# Altium project Sonography-v1.0.PrjPcb (part 2 of 2)

## Sheet Controller_Section.SchDoc
size A; DocumentNumber: 3; SheetNumber: 3; SheetTotal: 4
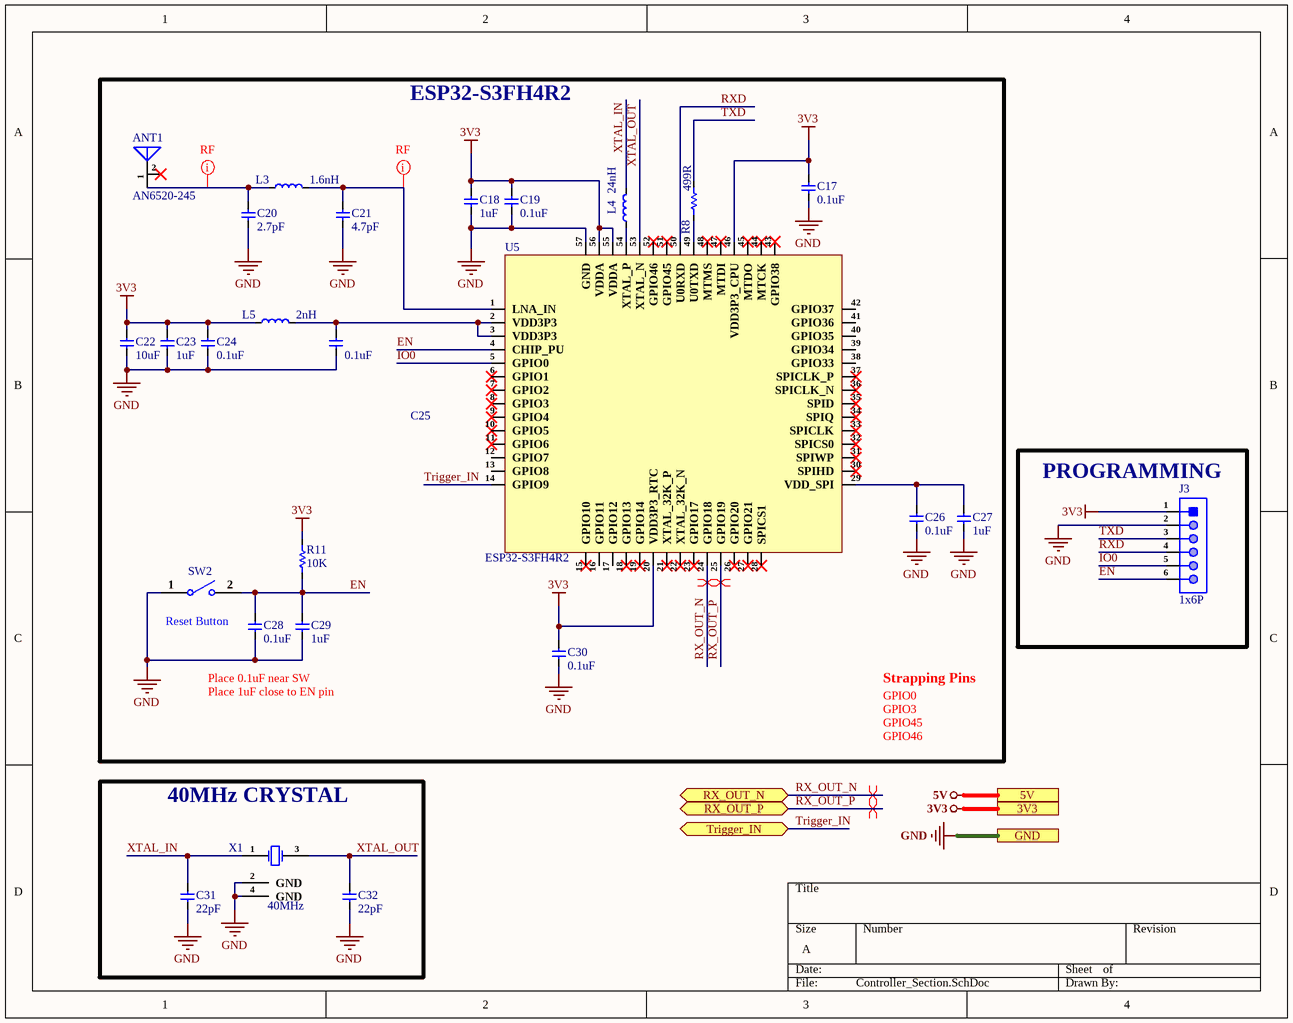
[diagram p2: Controller_Section.SchDoc]

### Parts
ANT1  AN6520-245  [AN6520-245]
C17  0.1uF  [CAP-0201]
C18  1uF  [CAP-0201]
C19  0.1uF  [CAP-0201]
C20  2.7pF  [CAP-0201]
C21  4.7pF  [CAP-0201]
C22  10uF  [Cap-0603]
C23  1uF  [CAP-0201]
C24  0.1uF  [CAP-0201]
C25  0.1uF  [CAP-0201]
C26  0.1uF  [CAP-0201]
C27  1uF  [CAP-0201]
C28  0.1uF  [CAP-0201]
C29  1uF  [CAP-0201]
C30  0.1uF  [CAP-0201]
C31  22pF  [CAP-0201]
C32  22pF  [CAP-0201]
J3  1x6P  [1x6p]
L3  1.6nH  [IND-0201]
L4  24nH  [IND-0201]
L5  2nH  [IND-0201]
R8  499R  [Res-0201]
R11  10K  [Res-0201]
SW2  B3U-1000P  [B3U-1000P]  (value not drawn)
U5  ESP32-S3FH4R2  [QFNWB-56 (7×7)]
X1  40MHz  [X322540MPB4SI_]

### Blocks framed on the sheet
ESP32-S3FH4R2: ANT1 C17-C30 L3-L5 R8 R11 SW2 U5
PROGRAMMING: J3
40MHz CRYSTAL: C31 C32 X1

### Ports
3V3 (see Top_sheet[2B], Power_Section[1D]), 5V (see Top_sheet[2B], Power_Section[1D], Transmitter_Receiver_Section[2D]), GND (see Top_sheet[3C], Power_Section[1D], Transmitter_Receiver_Section[2D]), RX_OUT_N (bidir, see Top_sheet[3B], Transmitter_Receiver_Section[1D]), RX_OUT_P (bidir, see Top_sheet[3B], Transmitter_Receiver_Section[1D]), Trigger_IN (bidir, see Top_sheet[3C], Transmitter_Receiver_Section[1D])

### Nets
3V3: C17.2 C18.2 C19.2 C22.2 C23.2 C24.2 C30.2 J3.1 L5.1 R11.2 U5.20(VDD3P3_RTC) U5.46(VDD3P3_CPU) U5.55(VDDA) U5.56(VDDA) ; port 3V3
GND: C17.1 C18.1 C19.1 C20.1 C21.1 C22.1 C23.1 C24.1 C25.1 C26.1 C27.1 C28.1 C29.1 C30.1 C31.1 C32.1 J3.2 SW2.1 U5.57(GND) X1.2(GND) X1.4(GND) ; port GND
EN: C28.2 C29.2 J3.6 R11.1 SW2.2 U5.4(CHIP_PU)
IO0: J3.5 U5.5(GPIO0)
RX_OUT_N: U5.24(GPIO18) ; port RX_OUT_N
RX_OUT_P: U5.25(GPIO19) ; port RX_OUT_P
RXD: J3.4 U5.50(U0RXD)
Trigger_IN: U5.14(GPIO9) ; port Trigger_IN
TXD: J3.3 R8.2
XTAL_IN: C31.2 L4.2 X1.1(CRYSTAL)
XTAL_OUT: C32.2 U5.53(XTAL_N) X1.3(CRYSTAL)
NetANT1_1: ANT1.1(FEED) C20.2 L3.1
NetC21_2: C21.2 L3.2 U5.1(LNA_IN)
NetC25_2: C25.2 L5.2 U5.2(VDD3P3) U5.3(VDD3P3)
NetC26_2: C26.2 C27.2 U5.29(VDD_SPI)
NetL4_1: L4.1 U5.54(XTAL_P)
NetR8_1: R8.1 U5.49(U0TXD)

Not connected (* = marked no-connect by the designer): ANT1 2(NC)*; U5 6(GPIO1)* 7(GPIO2)* 8(GPIO3)* 9(GPIO4)* 10(GPIO5)* 11(GPIO6)* 12(GPIO7) 13(GPIO8) 15(GPIO10)* 16(GPIO11) 17(GPIO12) 18(GPIO13)* 19(GPIO14)* 21(XTAL_32K_P)* 22(XTAL_32K_N)* 23(GPIO17)* 26(GPIO20)* 27(GPIO21)* 28(SPICS1)* 30(SPIHD)* 31(SPIWP)* 32(SPICS0)* 33(SPICLK)* 34(SPIQ)* 35(SPID)* 36(SPICLK_N)* 37(SPICLK_P)* 38(GPIO33) 39(GPIO34) 40(GPIO35) 41(GPIO36) 42(GPIO37) 43(GPIO38)* 44(MTCK)* 45(MTDO)* 47(MTDI)* 48(MTMS)* 51(GPIO45)* 52(GPIO46)*

### Layout directives
differential pair; differential pair class RX_OUT_Lines; net class RX_OUT; rule Matched Net Lengths [Tolerance = 50mil]; rule Impedance Constraint [Min = 85.00    Max = 90.00    ]: RX_OUT_N, RX_OUT_P
net class RF: NetANT1_1, NetC21_2

### Notes on the sheet
- Reset Button
- Place 1uF close to EN pin
- Place 0.1uF near SW
- Strapping Pins
- GPIO0
  GPIO3
  GPIO45
  GPIO46

### Library data of the parts
ANT1 = AN6520-245: SMD Antennas ROHS; Manufacturer: Rainsun microwave Tech; ComponentLink1Description: LCSC; ComponentLink1URL: https://www.lcsc.com/product-detail/Antennas_Rainsun-microwave-Tech-AN6520-245_C239238.html; Manufacturer Part Number: AN6520-245; Footprint: SMD; LCSC Part Number: C239238
C17 C19 C24-C26 C28 C30 = GRM033R61E104KE14D: CAP CER 0.1UF 25V X5R 0201; Manufacturer: Murata; Tolerance: 10%; Item Type: Capacitor; Material: 4241ConductorMaterial; Value: 100nF; Manufacturer Part Number: GRM033R61E104KE14D; RoHS: Yes; Category: Ceramic Capacitors; Case/Package: 0201; Case Code (Metric): 0603; Case Code (Imperial): 0201; Weight: 1.2E-05oz; Min Operating Temperature: -55°C; Max Operating Temperature: 85°C; Packaging: Tape and Reel; Voltage Rating: 25V; Dielectric: X5R; Termination: SMD/SMT; Voltage Rating (DC): 25V; Package Quantity: 15000; Series: GRM; Length: 0.024inch; Width: 0.012inch; Height: 0.3mm; Thickness: 0.013inch; Lead Free: Lead Free; RoHS Compliant: Yes; ComponentLink1URL: http://www.farnell.com/datasheets/2867843.pdf?src-supplier=Farnell; ComponentLink1Description: http://www.farnell.com/datasheets/2867843.pdf?src-supplier=Farnell; ComponentLink2URL: http://www.mouser.com/ds/2/281/c02e-2905.pdf?src-supplier=Mouser; ComponentLink2Description: http://www.mouser.com/ds/2/281/c02e-2905.pdf?src-supplier=Mouser; ComponentLink3URL: https://datasheet.octopart.com/GRM033R61E104KE14D-Murata-datasheet-22122223.pdf?src-supplier=Future+Electronics; ComponentLink3Description: https://datasheet.octopart.com/GRM033R61E104KE14D-Murata-datasheet-22122223.pdf?src-supplier=Future+Electronics; ComponentLink4URL: http://www.farnell.com/datasheets/2867843.pdf?src-supplier=Element14; ComponentLink4Description: http://www.farnell.com/datasheets/2867843.pdf?src-supplier=Element14; ComponentLink5URL: http://search.murata.co.jp/Ceramy/image/img/A01X/G101/ENG/GRM033R61E104KE14-01.pdf?src-supplier=Digi-Key; ComponentLink5Description: http://search.murata.co.jp/Ceramy/image/img/A01X/G101/ENG/GRM033R61E104KE14-01.pdf?src-supplier=Digi-Key; LCSC Part Number: C76939; Supplier: Rs; Supplier Part Number: 1852066; Stock: 14000; Pricing: 1000=0.008, 5000=0.007, 10000=0.006 (GBP); Mounting Technology: Surface Mount; ComponentLink6URL: http://www.farnell.com/datasheets/2867843.pdf?src-supplier=Newark; ComponentLink6Description: http://www.farnell.com/datasheets/2867843.pdf?src-supplier=Newark; ComponentLink7URL: https://datasheet.octopart.com/GRM033R61E104KE14D-Murata-datasheet-165579666.pdf?src-supplier=TME; ComponentLink7Description: https://datasheet.octopart.com/GRM033R61E104KE14D-Murata-datasheet-165579666.pdf?src-supplier=TME
C18 C23 C27 C29 = GRM033R61C105ME15D: CAP CER 1UF 16V X5R 0201; Manufacturer: Murata; Item Type: Capacitor; Supplier 1: Digi-Key; Manufacturer Part Number: GRM033R61C105ME15D; Stock 1: 12823; Pricing 1: 1=0.14, 10=0.098, 50=0.0554, 100=0.0459, 500=0.0322, 1000=0.02665, 2500=0.02481, 5000=0.0227 (USD); ComponentLink1URL: https://datasheet.octopart.com/GRM033R61C105ME15D-Murata-datasheet-155345049.pdf?src-supplier=Element14; ComponentLink1Description: https://datasheet.octopart.com/GRM033R61C105ME15D-Murata-datasheet-155345049.pdf?src-supplier=Element14; Supplier Part Number 1: 490-18654-1-ND; LCSC Part Number: C335102; RoHS: No; Category: Ceramic Capacitors; ComponentLink2URL: https://datasheet.octopart.com/GRM033R61C105ME15D-Murata-datasheet-165579666.pdf?src-supplier=TME; ComponentLink2Description: https://datasheet.octopart.com/GRM033R61C105ME15D-Murata-datasheet-165579666.pdf?src-supplier=TME
C20 = CC0201CRNPO9BN2R7: CAP CER 2.7PF 50V C0G/NPO 0201; Manufacturer: Yageo; Dielectric: C0G; Item Type: Capacitor; Supplier: Avnet; Supplier Part Number: CC0201CRNPO9BN2R7; Manufacturer Part Number: CC0201CRNPO9BN2R7; RoHS: Yes; Category: Ceramic Capacitors; Stock: 15000; Pricing: 15000=0.0017 (USD); Mounting Technology: Surface Mount; Case/Package: 0201; Case Code (Imperial): 0201; Case Code (Metric): 0603; Weight: 6E-06oz; Min Operating Temperature: -55°C; Max Operating Temperature: 125°C; Value: 2.7pF; Packaging: Tape and Reel; Voltage Rating (DC): 50V; Voltage Rating: 50V; Termination: SMD/SMT; Series: CC; Length: 0.024inch; Width: 0.012inch; Thickness: 0.013inch; RoHS Compliant: Yes; ComponentLink1URL: https://datasheet.ciiva.com/13208/upy-gp-np0-16v-to-50v-8-13208314.pdf?src-supplier=Mouser; ComponentLink1Description: https://datasheet.ciiva.com/13208/upy-gp-np0-16v-to-50v-8-13208314.pdf?src-supplier=Mouser; LCSC Part Number: C325439
C21 = CC0201BRNPO9BN4R7: CAP CER 4.7PF 50V C0G/NPO 0201; Manufacturer: Yageo; Item Type: Capacitor; Supplier: Arrow Electronics; Supplier Part Number: CC0201BRNPO9BN4R7; Manufacturer Part Number: CC0201BRNPO9BN4R7; RoHS: Yes; Category: Ceramic Capacitors; Stock: 210000; Pricing: 15000=0.0023 (USD); Mounting Technology: Surface Mount; Case/Package: 0201; Min Operating Temperature: -55°C; Max Operating Temperature: 125°C; Packaging: Tape and Reel; Value: 4.7pF; Voltage Rating: 50V; Series: CC; Length: 0.024inch; Width: 0.012inch; Thickness: 0.013inch; RoHS Compliant: Yes; ComponentLink1URL: https://www.yageo.com/upload/media/product/productsearch/datasheet/mlcc/UPY-GP_NP0_16V-to-50V_18.pdf?src-supplier=Digi-Key; ComponentLink1Description: https://www.yageo.com/upload/media/product/productsearch/datasheet/mlcc/UPY-GP_NP0_16V-to-50V_18.pdf?src-supplier=Digi-Key; ComponentLink2URL: http://www.yageo.com/documents/recent/UPY-GP_NP0_16V-to-50V_16.pdf?src-supplier=Digi-Key; ComponentLink2Description: http://www.yageo.com/documents/recent/UPY-GP_NP0_16V-to-50V_16.pdf?src-supplier=Digi-Key; LCSC Part Number: C505471
C22 = GRM188R6YA106MA73D: 10uF 35V X5R 20% Pad SMD 0603; Manufacturer: Murata; Supplier 1: Arrow Electronics; Manufacturer Part Number: GRM188R6YA106MA73D; RoHS: Yes; Category: Ceramic Capacitors; Stock 1: 37601; Pricing 1: 1=0.36650, 10=0.23380, 25=0.23160, 100=0.15050, 250=0.14890, 500=0.10700, 1000=0.09270, 3000=0.08640, 6000=0.07720, 15000=0.07140, 30000=0.05840 (USD); Mount: Surface Mount; Case/Package: 0603; Case Code (Metric): 1608; Case Code (Imperial): 0603; Min Operating Temperature: -55°C; Max Operating Temperature: 85°C; Packaging: Tape and Reel; Capacitance: 10uF; Voltage Rating: 35V; Tolerance: 20%; Voltage Rating (DC): 35V; Dielectric: X5R; Length: 0.063inch; Width: 0.031inch; Thickness: 0.039inch; RoHS Compliant: Yes; ComponentLink1URL: http://search.murata.co.jp/Ceramy/image/img/A01X/G101/ENG/GRM188R6YA106MA73-01.pdf?src-supplier=Future+Electronics; ComponentLink1Description: http://search.murata.co.jp/Ceramy/image/img/A01X/G101/ENG/GRM188R6YA106MA73-01.pdf?src-supplier=Future+Electronics; ComponentLink2URL: http://search.murata.co.jp/Ceramy/image/img/A01X/G101/ENG/GRM188R6YA106MA73-01.pdf?src-supplier=Digi-Key; ComponentLink2Description: http://search.murata.co.jp/Ceramy/image/img/A01X/G101/ENG/GRM188R6YA106MA73-01.pdf?src-supplier=Digi-Key; ComponentLink3URL: https://www.murata.com/~/media/webrenewal/support/library/catalog/products/capacitor/mlcc/c02e.ashx?la=en-us&src-supplier=Digi-Key; ComponentLink3Description: https://www.murata.com/~/media/webrenewal/support/library/catalog/products/capacitor/mlcc/c02e.ashx?la=en-us&src-supplier=Digi-Key; ComponentLink4URL: http://search.murata.co.jp/Ceramy/image/img/A01X/G101/ENG/GRM188R6YA106MA73-01.pdf?src-supplier=Mouser; ComponentLink4Description: http://search.murata.co.jp/Ceramy/image/img/A01X/G101/ENG/GRM188R6YA106MA73-01.pdf?src-supplier=Mouser; ComponentLink5URL: http://search.murata.co.jp/Ceramy/image/img/A01X/G101/ENG/GRM188R6YA106MA73-01.pdf?src-supplier=TTI; ComponentLink5Description: http://search.murata.co.jp/Ceramy/image/img/A01X/G101/ENG/GRM188R6YA106MA73-01.pdf?src-supplier=TTI; Supplier Part Number 1: GRM188R6YA106MA73D; LCSC Part Number: C194427
C31 C32 = GRM0335C1H220JA01D: CAP CER 22PF 50V C0G/NP0 0201; Manufacturer: Murata; Tolerance: 5%; Dielectric: C0G; Temperature Coefficient: 30ppm/°C; Item Type: Capacitor; Material: 4241ConductorMaterial; Manufacturer Part Number: GRM0335C1H220JA01D; RoHS: Yes; Category: Ceramic Capacitors; Mounting Technology: Surface Mount; Case/Package: 0201; Case Code (Metric): 0603; Case Code (Imperial): 0201; Min Operating Temperature: -55°C; Max Operating Temperature: 125°C; Value: 22pF; Voltage Rating: 50V; Packaging: Tape and Reel; Package Quantity: 1; Voltage Rating (DC): 50V; Termination: SMD/SMT; Voltage: 50V; Series: GRM; Length: 0.024inch; Width: 0.012inch; Height: 0.3mm; Depth: 0.3mm; Lead Free: Lead Free; RoHS Compliant: Yes; ComponentLink1URL: https://datasheet.ciiva.com/6271/partnumbering-e-01-6271146.pdf?src-supplier=Digi-Key; ComponentLink1Description: https://datasheet.ciiva.com/6271/partnumbering-e-01-6271146.pdf?src-supplier=Digi-Key; ComponentLink2URL: https://datasheet.ciiva.com/6271/partnumbering-e-01-6271143.pdf?src-supplier=Digi-Key; ComponentLink2Description: https://datasheet.ciiva.com/6271/partnumbering-e-01-6271143.pdf?src-supplier=Digi-Key; ComponentLink3URL: https://datasheet.ciiva.com/6271/partnumbering-e-01-6271149.pdf?src-supplier=Digi-Key; ComponentLink3Description: https://datasheet.ciiva.com/6271/partnumbering-e-01-6271149.pdf?src-supplier=Digi-Key; LCSC Part Number: C76924; Supplier: Rs; Supplier Part Number: 8202728; Stock: 9500; Pricing: 500=0.004, 5000=0.003, 12500=0.002, 50000=0.002 (GBP)
L3 = LQP03HQ1N6B02D: FIXED IND 1.6NH 1A 50 MOHM SMD; Manufacturer: Murata; Core Material: Non-Magnetic; Shielding: Unshielded; DC Resistance (DCR): 50mR; Self Resonant Frequency: 10GHz; Test Frequency: 500MHz; Item Type: Inductor; Supplier: Digi-Key; Supplier Part Number: 490-13883-1-ND; Manufacturer Part Number: LQP03HQ1N6B02D; RoHS: Yes; Category: Fixed Inductors; Stock: 27606; Pricing: 1=0.16, 10=0.145, 25=0.1236, 50=0.109, 100=0.1, 250=0.09088, 500=0.08544, 1000=0.06545, 2500=0.06181 (USD); Mounting Technology: Surface Mount; Case/Package: 0201; Case Code (Imperial): 0201; Case Code (Metric): 0603; Min Operating Temperature: -55°C; Max Operating Temperature: 125°C; Packaging: Cut Tape; Value: 1.6nH; Current Rating: 1A; Series: LQP03; RoHS Compliant: Yes; ComponentLink1URL: http://search.murata.co.jp/Ceramy/image/img/P02/JELF243C-0021.pdf?src-supplier=Digi-Key; ComponentLink1Description: http://search.murata.co.jp/Ceramy/image/img/P02/JELF243C-0021.pdf?src-supplier=Digi-Key; LCSC Part Number: C237384
L4 = LQP03TN24NH02D: 140mA 24nH ±3% 2.3Ω 0201 Inductors (SMD) ROHS; Manufacturer: Murata; Core Material: Non-Magnetic; Shielding: Unshielded; DC Resistance (DCR): 2.3R; Self Resonant Frequency: 2GHz; Test Frequency: 500MHz; Supplier: Digi-Key; Supplier Part Number: 490-13004-1-ND; Manufacturer Part Number: LQP03TN24NH02D; RoHS: Yes; Category: Fixed Inductors; Stock: 40849; Pricing: 1=0.1, 10=0.041, 25=0.0364, 50=0.031, 100=0.0273, 250=0.025, 500=0.02272, 1000=0.01909, 2500=0.01636 (USD); Mounting Technology: Surface Mount; Case/Package: 0201; Case Code (Metric): 0603; Case Code (Imperial): 0201; Min Operating Temperature: -55°C; Max Operating Temperature: 125°C; Package Quantity: 15000; Packaging: Tape and Reel; Tolerance: 3%; Current Rating: 140mA; Value: 24nH; DC Current: 140mA; Series: LQP03TN_02; Technology: THIN FILM; Length: 0.024inch; Width: 0.012inch; Height - Seated (Max): 0.013inch; Depth: 0.33mm; Military Standard: Not; RoHS Compliant: Yes; ComponentLink1URL: https://datasheet.ciiva.com/29692/s0084e-29692461.pdf?src-supplier=Digi-Key; ComponentLink1Description: https://datasheet.ciiva.com/29692/s0084e-29692461.pdf?src-supplier=Digi-Key; LCSC Part Number: C206441; Item Type: Inductor
L5 = MLG0603P2N0CT000: FIXED IND 2NH 600MA 100 MOHM SMD; Manufacturer: TDK; Item Type: Inductor; Core Material: Non-Magnetic; Shielding: Unshielded; DC Resistance (DCR): 100mR; Self Resonant Frequency: 8.5GHz; Test Frequency: 500MHz; Supplier: Digi-Key; Supplier Part Number: 445-172431-1-ND; Manufacturer Part Number: MLG0603P2N0CT000; RoHS: Yes; Category: Fixed Inductors; Stock: 23499; Pricing: 1=0.13, 10=0.118, 25=0.1, 50=0.0882, 100=0.0808, 250=0.07352, 500=0.06908, 1000=0.05292, 2500=0.04998 (USD); ComponentLink1URL: https://datasheet.ciiva.com/41860/inductor-commercial-high-frequency-mlg-qp-en-41860968.pdf?src-supplier=Digi-Key; ComponentLink1Description: https://datasheet.ciiva.com/41860/inductor-commercial-high-frequency-mlg-qp-en-41860968.pdf?src-supplier=Digi-Key; LCSC Part Number: C531323; Mounting Technology: Surface Mount; Case/Package: 0201; Case Code (Metric): 0603; Case Code (Imperial): 0201; Min Operating Temperature: -55°C; Max Operating Temperature: 125°C; Package Quantity: 15000; Packaging: Cut Tape; Current Rating: 600mA; Value: 2nH; Series: MLG-P; Length: 0.024inch; Width: 0.012inch; Height - Seated (Max): 0.013inch; RoHS Compliant: Yes
R8 = RC0201FR-07499RL: RES 499 OHM 1% 1/20W 0201; Manufacturer: Yageo; Max Power Dissipation: 50mW; Temperature Coefficient: 200ppm/°C; Item Type: Resistor; Supplier 1: Avnet; Manufacturer Part Number: RC0201FR-07499RL; RoHS: Yes; Category: Chip SMD Resistors; Stock 1: 150000; Pricing 1: 10000=0.00128 (USD); Case/Package: 0201; Case Code (Metric): 0603; Case Code (Imperial): 0201; Min Operating Temperature: -55°C; Max Operating Temperature: 125°C; Resistance: 499R; Tolerance: 1%; Packaging: Tape and Reel; Resistor Type: Thick Film; Number of Terminations: 2; Features: Moisture Resistant; Length: 0.024inch; Width: 0.012inch; Height: 0.01inch; Depth: 0.3mm; RoHS Compliant: Yes; Military Standard: Not; Lead Free: Lead Free; ComponentLink1URL: http://www.yageo.com/documents/recent/PYu-RC_Group_51_RoHS_L_10.pdf?src-supplier=Digi-Key; ComponentLink1Description: http://www.yageo.com/documents/recent/PYu-RC_Group_51_RoHS_L_10.pdf?src-supplier=Digi-Key; ComponentLink2URL: http://www.yageo.com/documents/recent/PYu-RC_Group_51_RoHS_L_9.pdf?src-supplier=Digi-Key; ComponentLink2Description: http://www.yageo.com/documents/recent/PYu-RC_Group_51_RoHS_L_9.pdf?src-supplier=Digi-Key; Supplier Part Number 1: RC0201FR-07499RL; LCSC Part Number: C138137
R11 = RC0201FR-0710KL: RES SMD 10K OHM 1% 1/20W 0201; Manufacturer: Yageo; Item Type: Resistor; Manufacturer Part Number: RC0201FR-0710KL; Package: 0201; ComponentLink7Description: LCSC; ComponentLink7URL: https://www.lcsc.com/product-detail/Chip-Resistor-Surface-Mount_YAGEO-RC0201FR-0710KL_C106225.html; LCSC Part Number: C106225
SW2 = B3U-1000P: SWITCH TACTILE SPST-NO 0.05A 12V; Manufacturer: Omron; Mechanical Life: 200000Cycles; Operating Force: 1.5N; Throw Configuration: SPST; Current Rating: 50mA; Contact Resistance: 100mR; Illumination Type: Non-Illuminated,Illuminated; Switch Travel: 0.15mm; Switch Function: Off-Mom; Actuator Type: Standard; Actuator Length: 0.4mm; Ratings: Dust Proof,IP40; ComponentLink1URL: http://www.farnell.com/datasheets/60838.pdf?src-supplier=Farnell; ComponentLink1Description: http://www.farnell.com/datasheets/60838.pdf?src-supplier=Farnell; ComponentLink2URL: http://www.farnell.com/datasheets/60838.pdf?src-supplier=Element14; ComponentLink2Description: http://www.farnell.com/datasheets/60838.pdf?src-supplier=Element14; ComponentLink3URL: https://omronfs.omron.com/en_US/ecb/products/pdf/en-b3u.pdf?src-supplier=Digi-Key; ComponentLink3Description: https://omronfs.omron.com/en_US/ecb/products/pdf/en-b3u.pdf?src-supplier=Digi-Key; ComponentLink4URL: http://www.omron.com/ecb/products/pdf/en-b3u.pdf?src-supplier=Digi-Key; ComponentLink4Description: http://www.omron.com/ecb/products/pdf/en-b3u.pdf?src-supplier=Digi-Key; ComponentLink5URL: https://www.distrelec.biz/Web/Downloads/he/et/B3U_eng_datasheet.pdf?mime=application%2Fpdf&src-supplier=Distrelec; ComponentLink5Description: https://www.distrelec.biz/Web/Downloads/he/et/B3U_eng_datasheet.pdf?mime=application%2Fpdf&src-supplier=Distrelec; ComponentLink6URL: http://www.onlinecomponents.com/productFiles/mf-OM/en-b3u.pdf?src-supplier=Onlinecomponents.com; ComponentLink6Description: http://www.onlinecomponents.com/productFiles/mf-OM/en-b3u.pdf?src-supplier=Onlinecomponents.com; Supplier 1: Digi-Key; Manufacturer Part Number: B3U-1000P; Stock 1: 116454; Pricing 1: 1=1, 10=0.961, 25=0.9064, 50=0.7976, 100=0.7251, 250=0.68888, 500=0.67074, 1000=0.52571 (USD); Mount: Surface Mount; Weight: 0.000776oz; Contact Material: Silver; Min Operating Temperature: -25°C; Max Operating Temperature: 70°C; Packaging: Tape and Reel; Voltage Rating (DC): 12V; Package Quantity: 1; Max Current Rating: 50mA; Termination: SMD/SMT; Orientation: Straight; Max Voltage Rating (DC): 12V; Electrical Life: 200000Cycles; Insulation Resistance: 100MR; Contact Current Rating: 50mA; Length: 4mm; Height: 1.2mm; Depth: 2.5mm; Width: 3mm; REACH SVHC: Unknown; Lead Free: Lead Free; ComponentLink7URL: https://www.verical.com/server-webapp/html/getDatasheet?partID=552554&src-supplier=Verical; ComponentLink7Description: https://www.verical.com/server-webapp/html/getDatasheet?partID=552554&src-supplier=Verical; ComponentLink8URL: http://www.farnell.com/datasheets/1685550.pdf?src-supplier=Element14; ComponentLink8Description: http://www.farnell.com/datasheets/1685550.pdf?src-supplier=Element14; ComponentLink9URL: http://www.farnell.com/datasheets/2610940.pdf?src-supplier=Farnell; ComponentLink9Description: http://www.farnell.com/datasheets/2610940.pdf?src-supplier=Farnell; ComponentLink10URL: https://www.alliedelec.com/m/d/4c8a9ef82804fc3c241a13c1e298fd73.pdf?src-supplier=Allied+Electronics; ComponentLink10Description: https://www.alliedelec.com/m/d/4c8a9ef82804fc3c241a13c1e298fd73.pdf?src-supplier=Allied+Electronics; Supplier Part Number 1: SW1020DKR-ND; LCSC Part Number: C231329; Item Type: Switch
U5 = ESP32-S3FH4R2: 21dBm ESP32-S3R8 2.4GHz SMD WiFi Modules ROHS; Manufacturer: Espressif Systems; Item Type: IC; Supplier: Mouser; Supplier Part Number: 356-ESP32-S3FH4R2; Manufacturer Part Number: ESP32-S3FH4R2; RoHS: No; Stock: 2650; Pricing: 1=2.32, 10=2.32, 50=2.32, 100=2.32, 1000=2.32, 10000=2.32 (USD); LCSC Part Number: C3013940; ComponentLink1Description: LCSC; ComponentLink1URL: https://www.lcsc.com/product-detail/WiFi-Modules_Espressif-Systems-ESP32-S3FH4R2_C3013940.html
X1 = X322540MPB4SI: 40MHz SMD Crystal Resonator 15pF SMD3225-4P Crystals ROHS; Manufacturer: Yangxing Tech; Manufacturer Part Number: X322540MPB4SI; Value: 40MHZ; LCSC Part Number: C9010; ComponentLink1Description: LCSC; ComponentLink1URL: https://www.lcsc.com/product-detail/Crystals_Yangxing-Tech-X322540MPB4SI_C9010.html; Item Type: Crystal

## Sheet Power_Section.SchDoc
size A; DocumentNumber: 2; SheetNumber: 2; SheetTotal: 4
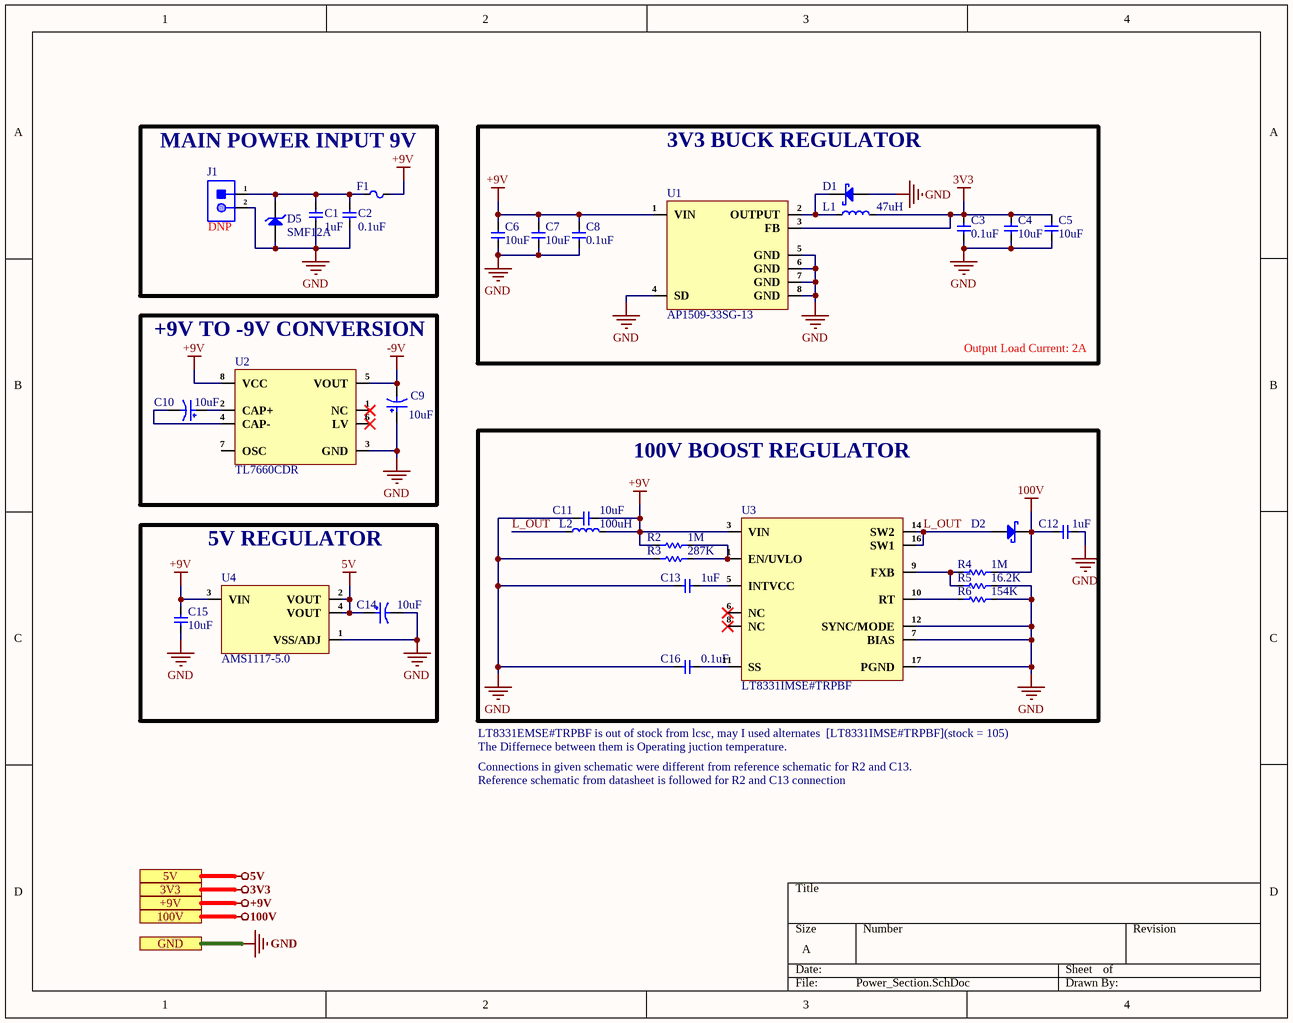
[diagram p3: Power_Section.SchDoc]

### Parts
C1  1uF  [CAP-0201]
C2  0.1uF  [CAP-0201]
C3  0.1uF  [CAP-0201]
C4  10uF  [Cap-0603]
C5  10uF  [Cap-0603]
C6  10uF  [Cap-0603]
C7  10uF  [Cap-0603]
C8  0.1uF  [CAP-0201]
C9  10uF  [Case-B]
C10  10uF  [Case-B]
C11  10uF  [Cap-0603]
C12  1uF  [Cap-1812]
C13  1uF  [CAP-0201]
C14  10uF  [Case-B]
C15  10uF  [Cap-0603]
C16  0.1uF  [CAP-0201]
D1  B340A  [SMA(DO-214AC)]  (value not drawn)
D2  RB558VAM150TR  [SOD-323HE]  (value not drawn)
D5  SMF12A  [SOD-123F]
F1  SMD2018-200  [SMD2018-200]  (value not drawn)
J1  X6521WVS-2x01H-C60D74  [X6521WVS-2x01H-C60D74]  (value not drawn)
L1  47uH  [SMMS1050-470M]
L2  100uH  [SDR1307A-101K]
R2  1M  [Res-0402]
R3  287K  [Res-0201]
R4  1M  [Res-0402]
R5  16.2K  [Res-0201]
R6  154K  [Res-0201]
U1  AP1509-33SG-13  [SOP-8L]
U2  TL7660CDR  [SOIC-8(0.154", 3.90mm Width)]
U3  LT8331IMSE#TRPBF  [16-MSOP-EP]
U4  AMS1117-5.0  [SOT- 223]

### Blocks framed on the sheet
MAIN POWER INPUT 9V: C1 C2 D5 F1 J1
3V3 BUCK REGULATOR: C3-C8 D1 L1 U1
+9V TO -9V CONVERSION: C9 C10 U2
100V BOOST REGULATOR: C11-C13 C16 D2 L2 R2-R6 U3
5V REGULATOR: C14 C15 U4

### Ports
3V3 (see Top_sheet[1B], Controller_Section[4D]), 5V (see Top_sheet[1B], Controller_Section[4D], Transmitter_Receiver_Section[2D]), 100V (see Top_sheet[1B], Transmitter_Receiver_Section[2D]), +9V (see Top_sheet[1B], Transmitter_Receiver_Section[2D]), GND (see Top_sheet[2C], Controller_Section[4D], Transmitter_Receiver_Section[2D])

### Nets
3V3: C3.2 C4.2 C5.2 L1.2 U1.3(FB) ; port 3V3
5V: C14.1 U4.2(VOUT) U4.4(VOUT) ; port 5V
100V: C12.2 D2.1(K) R4.2 ; port 100V
+9V: C6.2 C7.2 C8.2 C11.1 C15.2 F1.2 L2.2 R2.1 U1.1(VIN) U2.8(VCC) U3.3(VIN) U4.3(VIN) ; port +9V
-9V: C9.2 U2.5(VOUT)
GND: C1.1 C2.1 C3.1 C4.1 C5.1 C6.1 C7.1 C8.1 C9.1 C11.2 C12.1 C13.2 C14.2 C15.1 C16.2 D1.2(A) D5.2(A) J1.2 R3.1 R5.2 R6.2 U1.4(SD) U1.5(GND) U1.6(GND) U1.7(GND) U1.8(GND) U2.3(GND) U3.7(BIAS) U3.12(SYNC/MODE) U3.17(PGND) U4.1(VSS/ADJ) ; port GND
L_OUT: D2.2(A) L2.1 U3.14(SW2) U3.16(SW1)
NetC1_2: C1.2 C2.2 D5.1(K) F1.1 J1.1
NetC10_1: C10.1 U2.2(CAP+)
NetC10_2: C10.2 U2.4(CAP-)
NetC13_1: C13.1 U3.5(INTVCC)
NetC16_1: C16.1 U3.11(SS)
NetD1_1: D1.1(K) L1.1 U1.2(OUTPUT)
NetR2_2: R2.2 R3.2 U3.1(EN/UVLO)
NetR4_1: R4.1 R5.1 U3.9(FXB)
NetR6_1: R6.1 U3.10(RT)

Not connected (* = marked no-connect by the designer): U2 1(NC)* 6(LV)* 7(OSC); U3 6(NC)* 8(NC)*

### Notes on the sheet
- (near J1) DNP
- Output Load Current: 2A
- LT8331EMSE#TRPBF is out of stock from lcsc, may I used alternates  [LT8331IMSE#TRPBF](stock = 105)
- The Differnece between them is Operating juction temperature.
- Connections in given schematic were different from reference schematic for R2 and C13.
- Reference schematic from datasheet is followed for R2 and C13 connection

### Library data of the parts
C1 C13 = GRM033R61C105ME15D: as C18 on sheet Controller_Section; Supplier 1: Digi-Key; Manufacturer Part Number: GRM033R61C105ME15D; RoHS: No; Category: Ceramic Capacitors; Stock 1: 12823; Pricing 1: 1=0.14, 10=0.098, 50=0.0554, 100=0.0459, 500=0.0322, 1000=0.02665, 2500=0.02481, 5000=0.0227 (USD); ComponentLink1URL: https://datasheet.octopart.com/GRM033R61C105ME15D-Murata-datasheet-155345049.pdf?src-supplier=Element14; ComponentLink1Description: https://datasheet.octopart.com/GRM033R61C105ME15D-Murata-datasheet-155345049.pdf?src-supplier=Element14; ComponentLink2URL: https://datasheet.octopart.com/GRM033R61C105ME15D-Murata-datasheet-165579666.pdf?src-supplier=TME; ComponentLink2Description: https://datasheet.octopart.com/GRM033R61C105ME15D-Murata-datasheet-165579666.pdf?src-supplier=TME; LCSC Part Number: C335102; Supplier Part Number 1: 490-18654-1-ND
C2 C3 C8 C16 = GRM033R61E104KE14D: CAP CER 0.1UF 25V X5R 0201; Manufacturer: Murata; Material: 4241ConductorMaterial; Value: 100nF; Tolerance: 10%; Item Type: Capacitor; Supplier: Rs; Supplier Part Number: 1852066; Manufacturer Part Number: GRM033R61E104KE14D; RoHS: Yes; Category: Ceramic Capacitors; Stock: 14000; Pricing: 1000=0.008, 5000=0.007, 10000=0.006 (GBP); Mounting Technology: Surface Mount; Case/Package: 0201; Case Code (Metric): 0603; Case Code (Imperial): 0201; Weight: 1.2E-05oz; Min Operating Temperature: -55°C; Max Operating Temperature: 85°C; Packaging: Tape and Reel; Voltage Rating: 25V; Dielectric: X5R; Termination: SMD/SMT; Voltage Rating (DC): 25V; Package Quantity: 15000; Series: GRM; Length: 0.024inch; Width: 0.012inch; Height: 0.3mm; Thickness: 0.013inch; Lead Free: Lead Free; RoHS Compliant: Yes; ComponentLink1URL: http://www.farnell.com/datasheets/2867843.pdf?src-supplier=Farnell; ComponentLink1Description: http://www.farnell.com/datasheets/2867843.pdf?src-supplier=Farnell; ComponentLink2URL: http://www.mouser.com/ds/2/281/c02e-2905.pdf?src-supplier=Mouser; ComponentLink2Description: http://www.mouser.com/ds/2/281/c02e-2905.pdf?src-supplier=Mouser; ComponentLink3URL: https://datasheet.octopart.com/GRM033R61E104KE14D-Murata-datasheet-22122223.pdf?src-supplier=Future+Electronics; ComponentLink3Description: https://datasheet.octopart.com/GRM033R61E104KE14D-Murata-datasheet-22122223.pdf?src-supplier=Future+Electronics; ComponentLink4URL: http://www.farnell.com/datasheets/2867843.pdf?src-supplier=Element14; ComponentLink4Description: http://www.farnell.com/datasheets/2867843.pdf?src-supplier=Element14; ComponentLink5URL: http://search.murata.co.jp/Ceramy/image/img/A01X/G101/ENG/GRM033R61E104KE14-01.pdf?src-supplier=Digi-Key; ComponentLink5Description: http://search.murata.co.jp/Ceramy/image/img/A01X/G101/ENG/GRM033R61E104KE14-01.pdf?src-supplier=Digi-Key; ComponentLink6URL: http://www.farnell.com/datasheets/2867843.pdf?src-supplier=Newark; ComponentLink6Description: http://www.farnell.com/datasheets/2867843.pdf?src-supplier=Newark; ComponentLink7URL: https://datasheet.octopart.com/GRM033R61E104KE14D-Murata-datasheet-165579666.pdf?src-supplier=TME; ComponentLink7Description: https://datasheet.octopart.com/GRM033R61E104KE14D-Murata-datasheet-165579666.pdf?src-supplier=TME; LCSC Part Number: C76939
C4-C7 C11 C15 = GRM188R6YA106MA73D: as C22 on sheet Controller_Section; Supplier 1: Arrow Electronics; Manufacturer Part Number: GRM188R6YA106MA73D; RoHS: Yes; Category: Ceramic Capacitors; Stock 1: 37601; Pricing 1: 1=0.36650, 10=0.23380, 25=0.23160, 100=0.15050, 250=0.14890, 500=0.10700, 1000=0.09270, 3000=0.08640, 6000=0.07720, 15000=0.07140, 30000=0.05840 (USD); Mount: Surface Mount; Case/Package: 0603; Case Code (Metric): 1608; Case Code (Imperial): 0603; Min Operating Temperature: -55°C; Max Operating Temperature: 85°C; Packaging: Tape and Reel; Capacitance: 10uF; Voltage Rating: 35V; Tolerance: 20%; Voltage Rating (DC): 35V; Dielectric: X5R; Length: 0.063inch; Width: 0.031inch; Thickness: 0.039inch; RoHS Compliant: Yes; ComponentLink1URL: http://search.murata.co.jp/Ceramy/image/img/A01X/G101/ENG/GRM188R6YA106MA73-01.pdf?src-supplier=Future+Electronics; ComponentLink1Description: http://search.murata.co.jp/Ceramy/image/img/A01X/G101/ENG/GRM188R6YA106MA73-01.pdf?src-supplier=Future+Electronics; ComponentLink2URL: http://search.murata.co.jp/Ceramy/image/img/A01X/G101/ENG/GRM188R6YA106MA73-01.pdf?src-supplier=Digi-Key; ComponentLink2Description: http://search.murata.co.jp/Ceramy/image/img/A01X/G101/ENG/GRM188R6YA106MA73-01.pdf?src-supplier=Digi-Key; ComponentLink3URL: https://www.murata.com/~/media/webrenewal/support/library/catalog/products/capacitor/mlcc/c02e.ashx?la=en-us&src-supplier=Digi-Key; ComponentLink3Description: https://www.murata.com/~/media/webrenewal/support/library/catalog/products/capacitor/mlcc/c02e.ashx?la=en-us&src-supplier=Digi-Key; ComponentLink4URL: http://search.murata.co.jp/Ceramy/image/img/A01X/G101/ENG/GRM188R6YA106MA73-01.pdf?src-supplier=Mouser; ComponentLink4Description: http://search.murata.co.jp/Ceramy/image/img/A01X/G101/ENG/GRM188R6YA106MA73-01.pdf?src-supplier=Mouser; ComponentLink5URL: http://search.murata.co.jp/Ceramy/image/img/A01X/G101/ENG/GRM188R6YA106MA73-01.pdf?src-supplier=TTI; ComponentLink5Description: http://search.murata.co.jp/Ceramy/image/img/A01X/G101/ENG/GRM188R6YA106MA73-01.pdf?src-supplier=TTI; Supplier Part Number 1: GRM188R6YA106MA73D; LCSC Part Number: C194427
C9 C10 C14 = CA45-B025K106T: 10uF 25V 2.5Ω@100kHz ±10% CASE-B-3528 Tantalum Capacitors ROHS; Manufacturer: Xiangyee in S&T; Manufacturer Part Number: CA45-B025K106T; ComponentLink1URL: https://www.lcsc.com/product-detail/Tantalum-Capacitors_Hunan-Xiangyee-in-S-T-CA45-B025K106T_C119050.html; ComponentLink1Description: LCSC; LCSC Part Number: C119050; Item Type: Capacitor; Package: Case-B
C12 = FS43X105K251EGG: 250V 1uF X7R ±10% 1812 Multilayer Ceramic Capacitors MLCC - SMD/SMT ROHS; Manufacturer: PSA; Manufacturer Part Number: FS43X105K251EGG; Package: 1812; LCSC Part Number: C381468; Item Type: Capacitor; ComponentLink1Description: LCSC; ComponentLink1URL: https://www.lcsc.com/product-detail/Multilayer-Ceramic-Capacitors-MLCC-SMD-SMT_PSA-Prosperity-Dielectrics-FS43X105K251EGG_C381468.html
D1 = B340A: 40V 3A 550mV@3A SMA(DO-214AC) Schottky Barrier Diodes (SBD) ROHS; Manufacturer: FUXINSEMI; Item Type: Diode; Manufacturer Part Number: B340A; Package: SMA(DO-214AC); LCSC Part Number: C3018525; ComponentLink1Description: LCSC; ComponentLink1URL: https://www.lcsc.com/product-detail/Schottky-Barrier-Diodes-SBD_FUXINSEMI-B340A_C3018525.html
D2 = RB558VAM150TR: Diode Schottky 150V 500mA 2-Pin SOD-323HE Emboss T/R; Manufacturer: Rohm; Item Type: Schottky Barrier Diodes; Supplier: Digi-Key; Supplier Part Number: 846-RB558VAM150TR-ND; Manufacturer Part Number: RB558VAM150TR; RoHS: Yes; Category: Schottky Diodes; Stock: 30000; Pricing: 3000=0.07231, 6000=0.06914, 9000=0.05979, 30000=0.05867, 75000=0.04858, 150000=0.04783 (USD); Mounting Technology: Surface Mount; Case/Package: SMD/SMT; Series: *; Average Rectified Current: 500mA; Max Reverse Voltage (DC): 150V; RoHS Compliant: Yes; LCSC Part Number: C5336764
D5 = SMF12A: 10.1A 200W 19.9V 13.3V 12V SOD-123F Electrostatic and Surge Protection (TVS/ESD) ROHS; Manufacturer: Shandong Jingdao Microelectronics; Item Type: Diode; LCSC Part Number: C178259; Manufacturer Part Number: SMF12A; Package: SOD-123F; ComponentLink7Description: LCSC; ComponentLink7URL: https://www.lcsc.com/product-detail/TVS_AnBon-SMBJ5-0A_C440263.html
F1 = SMD2018-200: 10V 2A 100A 4A 2018 Resettable Fuses ROHS; Manufacturer: Tech Fuse; Item type: Fuse; ComponentLink1Description: LCSC; ComponentLink1URL: https://www.lcsc.com/product-detail/Resettable-Fuses_TECHFUSE-SMD2018-200_C70152.html; Manufacturer Part Number: SMD2018-200; Package: 2018; LCSC Part Number: C70152
J1 = X6521WVS-2x01H-C60D74: Gold 250V 3A Brick nogging Square Pins 2.5mm 2P 260℃ 6mm -40℃~+105℃ 2.54mm 双排 Black Brass 2x1P SMD,P=2.54mm Pin Headers ROHS; Manufacturer: XKB Connectivity; Item Type: Connector; Manufacturer Part Number: X6521WVS-2x01H-C60D74; Package: SMD,P=2.54mm; LCSC Part Number: C2884014; ComponentLink1Description: LCSC; ComponentLink1URL: https://www.lcsc.com/product-detail/Pin-Headers_XKB-Connectivity-X6521WVS-2x01H-C60D74_C2884014.html
L1 = SMMS1050-470M: 3A 47uH Molding Choke ±20% 4.5A SMD Power Inductors ROHS; Manufacturer: SXN; Footprint: SMD; Manufacturer Part Number: SMMS1050-470M; Value: 47uH; LCSC Part Number: C149548; ComponentLink1Description: LCSC; ComponentLink1URL: https://www.lcsc.com/product-detail/Power-Inductors_SXN-Shun-Xiang-Nuo-Elec-SMMS1050-470M_C149548.html
L2 = SDR1307A-101K: Ind Power Unshielded Wirewound 100uH 10% 100KHz 25Q-Factor Ferrite 1.9A T/R; Manufacturer: Bourns; Item Type: Inductor; Supplier: Digi-Key; Supplier Part Number: SDR1307A-101KCT-ND; Manufacturer Part Number: SDR1307A-101K; RoHS: Yes; Category: Fixed Inductors; Stock: 2952; Pricing: 1=1.16, 10=0.982, 25=0.8928, 50=0.8392, 100=0.6964 (USD); ComponentLink1URL: https://datasheet.ciiva.com/46435/1778094-46435133.pdf?src-supplier=Element14; ComponentLink1Description: https://datasheet.ciiva.com/46435/1778094-46435133.pdf?src-supplier=Element14; LCSC Part Number: C2042930; ComponentLink2Description: LCSC; ComponentLink2URL: https://www.lcsc.com/product-detail/Power-Inductors_BOURNS-SDR1307A-101K_C2042930.html
R2 R4 = WF04H1004DTL: 125mW ±100ppm/℃ ±0.5% 1MΩ 0402 Chip Resistor - Surface Mount ROHS; Manuacturer: Walsin Tech Crop; Manufacturer Part Number: WF04H1004DTL; Package: 0402; Value: 1M; LCSC Part Number: C305257; ComponentLink1Description: LCSC; ComponentLink1URL: https://www.lcsc.com/product-detail/Chip-Resistor-Surface-Mount_Walsin-Tech-Corp-WF04H1004DTL_C305257.html
R3 = RC0201FR-07287KL: SMD Chip Resistor, 287 kOhm, ± 1%, 50 mW, 0201 [0603 Metric], Thick Film, General Purpose; Manufacturer: YAGEO; Value: 287kR; Max Power Dissipation: 50mW; Temperature Coefficient: 200ppm/°C; Voltage Rating: 25V; Manufacturer Part Number: RC0201FR-07287KL; LCSC Part Number: C474636; Item Type: Resistor; Package: 0201; ComponentLink1Description: LCSC; ComponentLink1URL: https://www.lcsc.com/product-detail/Chip-Resistor-Surface-Mount_YAGEO-RC0201FR-07287KL_C474636.html; Supplier: Arrow Electronics; Supplier Part Number: RC0201FR-07287KL; RoHS: Yes; Category: Chip SMD Resistors; Stock: 19914; Pricing: 1=0.057, 10=0.0097, 25=0.0092, 100=0.0057, 250=0.0056, 500=0.0054, 1000=0.0034, 3000=0.0032, 6000=0.0023 (USD); Case/Package: 0201; Case Code (Metric): 0603; Case Code (Imperial): 0201; Min Operating Temperature: -55°C; Max Operating Temperature: 125°C; Packaging: Cut Tape; Number of Terminations: 2; Tolerance: 1%; Features: Moisture Resistant; Series: RC; Length: 0.024inch; Width: 0.012inch; Height: 0.01inch; RoHS Compliant: Yes; ComponentLink2URL: http://www.yageo.com/documents/recent/PYu-RC_Group_51_RoHS_L_9.pdf?src-supplier=Digi-Key; ComponentLink2Description: http://www.yageo.com/documents/recent/PYu-RC_Group_51_RoHS_L_9.pdf?src-supplier=Digi-Key; ComponentLink3URL: https://www.yageo.com/upload/media/product/productsearch/datasheet/rchip/PYu-RC_Group_51_RoHS_L_11.pdf?src-supplier=Digi-Key; ComponentLink3Description: https://www.yageo.com/upload/media/product/productsearch/datasheet/rchip/PYu-RC_Group_51_RoHS_L_11.pdf?src-supplier=Digi-Key
R5 = RTT011622FTH: 50mW Thick Film Resistors 25V ±1% ±200ppm/℃ 16.2kΩ 0201 Chip Resistor - Surface Mount ROHS; Manufacturer: RALEC; Manufacturer Part Number: RTT011622FTH; Package: 0201; LCSC Part Number: C166338; Item Type: Resistor; ComponentLink1Description: LCSC; ComponentLink1URL: https://www.lcsc.com/product-detail/Chip-Resistor-Surface-Mount_RALEC-RTT011622FTH_C166338.html
R6 = RC0201FR-07154KL: Res Thick Film 0201 154K Ohm 1% 1/20W ±200ppm/°C Molded SMD Paper T/R; Manufacturer: YAGEO; Item Type: Resistor; Value: 154kR; Max Power Dissipation: 50mW; Manufacturer Part Number: RC0201FR-07154KL; Package: 0201; ComponentLink1Description: LCSC; ComponentLink1URL: https://www.lcsc.com/product-detail/Chip-Resistor-Surface-Mount_YAGEO-RC0201FR-07154KL_C474540.html; LCSC Part Number: C474540; Supplier: Future Electronics; Supplier Part Number: 3110231; RoHS: Yes; Category: Chip SMD Resistors; Stock: 110000; Pricing: 10000=0.0014, 50000=0.0013, 250000=0.0013, 750000=0.0012, 2000000=0.0011 (USD); Case/Package: 0201; Case Code (Metric): 0603; Case Code (Imperial): 0201; Min Operating Temperature: -55°C; Max Operating Temperature: 125°C; Packaging: Cut Tape; Number of Terminations: 2; Tolerance: 1%; Temperature Coefficient: 200ppm/°C; Features: Moisture Resistant; Series: RC; Length: 0.024inch; Width: 0.012inch; Height: 0.01inch; RoHS Compliant: Yes; ComponentLink2URL: http://www.yageo.com/documents/recent/PYu-RC_Group_51_RoHS_L_9.pdf?src-supplier=Digi-Key; ComponentLink2Description: http://www.yageo.com/documents/recent/PYu-RC_Group_51_RoHS_L_9.pdf?src-supplier=Digi-Key; ComponentLink3URL: https://www.yageo.com/upload/media/product/productsearch/datasheet/rchip/PYu-RC_Group_51_RoHS_L_11.pdf?src-supplier=Digi-Key; ComponentLink3Description: https://www.yageo.com/upload/media/product/productsearch/datasheet/rchip/PYu-RC_Group_51_RoHS_L_11.pdf?src-supplier=Digi-Key; ComponentLink4URL: http://www.yageo.com.tw/exep/pages/download/literatures/PYu-R_INT-thick_7.pdf?src-supplier=Digi-Key; ComponentLink4Description: http://www.yageo.com.tw/exep/pages/download/literatures/PYu-R_INT-thick_7.pdf?src-supplier=Digi-Key
U1 = AP1509-33SG-13: IC REG BUCK 3.3V 2A 8SOIC; Manufacturer: Diodes; Item Type: Regulator; Supplier: Digi-Key; Supplier Part Number: AP1509-33SGDICT-ND; Manufacturer Part Number: AP1509-33SG-13; RoHS: Yes; Category: Voltage Regulators - Switching; Stock: 7160; Pricing: 1=1.6, 10=1.43, 25=1.3576, 100=1.115, 250=1.04232, 500=0.92112, 1000=0.7272 (USD); ComponentLink1URL: https://datasheet.ciiva.com/2024/ap1509-2024112.pdf?src-supplier=Digi-Key; ComponentLink1Description: https://datasheet.ciiva.com/2024/ap1509-2024112.pdf?src-supplier=Digi-Key; ComponentLink2URL: https://datasheet.ciiva.com/22696/608784-22696879.pdf?src-supplier=Element14; ComponentLink2Description: https://datasheet.ciiva.com/22696/608784-22696879.pdf?src-supplier=Element14; ComponentLink3URL: https://datasheet.ciiva.com/3220/ap1509-3220415.pdf?src-supplier=Avnet; ComponentLink3Description: https://datasheet.ciiva.com/3220/ap1509-3220415.pdf?src-supplier=Avnet; ComponentLink4URL: https://datasheet.ciiva.com/3222/ap1509-3222047.pdf?src-supplier=Avnet; ComponentLink4Description: https://datasheet.ciiva.com/3222/ap1509-3222047.pdf?src-supplier=Avnet; ComponentLink5URL: https://datasheet.ciiva.com/1161/608784-1161659.pdf?src-supplier=Element14; ComponentLink5Description: https://datasheet.ciiva.com/1161/608784-1161659.pdf?src-supplier=Element14; LCSC Part no: C151823
U2 = TL7660CDR: Charge Pump INV/STPUP/STPDN -1.5V to -10V 100mA 8-Pin SOIC T/R / IC REG SWITCHD CAP INV 8SOIC; Manufacturer: Texas Instruments; Supplier: Digi-Key; Supplier Part Number: 296-21856-1-ND; Manufacturer Part Number: TL7660CDR; RoHS: Yes; Category: Voltage Regulators - Switching; Stock: 5011; Pricing: 1=1.15, 10=1.024, 25=0.9716, 100=0.798, 250=0.746, 500=0.65926, 1000=0.52046 (USD); ComponentLink1URL: https://datasheet.ciiva.com/15114/getdatasheetpartid-314156-15114111.pdf?src-supplier=Verical; ComponentLink1Description: https://datasheet.ciiva.com/15114/getdatasheetpartid-314156-15114111.pdf?src-supplier=Verical; ComponentLink2URL: https://datasheet.ciiva.com/2033/tl7660-2033856.pdf?src-supplier=Digi-Key; ComponentLink2Description: https://datasheet.ciiva.com/2033/tl7660-2033856.pdf?src-supplier=Digi-Key; ComponentLink3URL: https://datasheet.ciiva.com/41462/001014582-da-01-en-ic-reg-multi-config-tl7660cdr-soic-8-tid-41462430.pdf?src-supplier=Conrad; ComponentLink3Description: https://datasheet.ciiva.com/41462/001014582-da-01-en-ic-reg-multi-config-tl7660cdr-soic-8-tid-41462430.pdf?src-supplier=Conrad; ComponentLink4URL: https://datasheet.ciiva.com/3216/tl7660-3216343.pdf?src-supplier=Avnet; ComponentLink4Description: https://datasheet.ciiva.com/3216/tl7660-3216343.pdf?src-supplier=Avnet; ComponentLink5URL: https://datasheet.ciiva.com/2033/tl7660-2033857.pdf?src-supplier=Digi-Key; ComponentLink5Description: https://datasheet.ciiva.com/2033/tl7660-2033857.pdf?src-supplier=Digi-Key; ComponentLink6URL: https://datasheet.ciiva.com/2033/tl7660-2033858.pdf?src-supplier=Digi-Key; ComponentLink6Description: https://datasheet.ciiva.com/2033/tl7660-2033858.pdf?src-supplier=Digi-Key; LCSC Part Number: C130206; Item Type: IC
U3 = LT8331IMSE#TRPBF: IC REG MULTI CONFG ADJ 16MSOP; Manufacturer: Analog Devices; Manufacturer Part Number: LT8331IMSE#TRPBF; Package: MSOP-12; LCSC Part Number: C673751; ComponentLink1Description: LCSC; ComponentLink1URL: https://www.lcsc.com/product-detail/DC-DC-Converters_Analog-Devices-LT8331IMSE-TRPBF_C673751.html; Item Type: IC
U4 = AMS1117-5.0: SOT-223 Linear Voltage Regulators (LDO) ROHS; Manufacturer: HX(hengjiaxing); Item Type: IC; Manufacturer Part Number: AMS1117-5.0; Package: SOT-223; LCSC Part Number: C5181462; ComponentLink1Description: LCSC; ComponentLink1URL: https://www.lcsc.com/product-detail/Linear-Voltage-Regulators-LDO_HX-hengjiaxing-AMS1117-5-0_C5181462.html

## Nets that join several sheets
3V3: Controller_Section (14 pins), Power_Section (5 pins)
5V: Transmitter_Receiver_Section (R12.1 U6.14), Power_Section (C14.1 U4.2 U4.4)
100V: Transmitter_Receiver_Section (C33.2 C34.1 R13.2), Power_Section (C12.2 D2.1 R4.2)
+9V: Transmitter_Receiver_Section (11 pins), Power_Section (12 pins)
-9V: Transmitter_Receiver_Section (8 pins), Power_Section (C9.2 U2.5)
GND: Transmitter_Receiver_Section (29 pins), Controller_Section (21 pins), Power_Section (31 pins)
RX_OUT_N: Transmitter_Receiver_Section (J5.1 R29.1), Controller_Section (U5.24)
RX_OUT_P: Transmitter_Receiver_Section (D4.1 J5.2), Controller_Section (U5.25)
Trigger_IN: Transmitter_Receiver_Section (C39.2), Controller_Section (U5.14)